# Altium schematic sheet Top_Sheet.SchDoc
size 420 x 297 mm; SheetNumber: 1; SheetTotal: 5
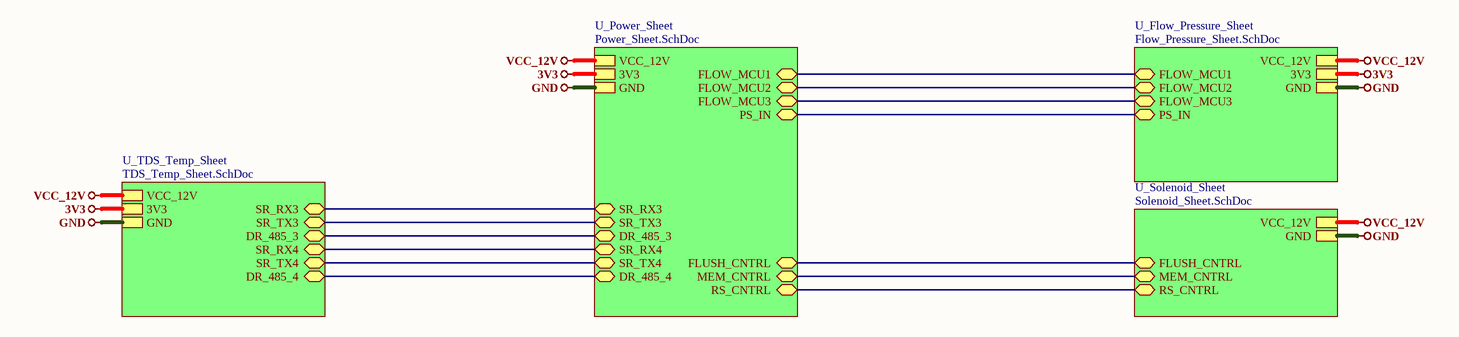
[diagram p0: Top_Sheet.SchDoc]

## Sub-sheets
U_Flow_Pressure_Sheet = Flow_Pressure_Sheet.SchDoc: VCC_12V, GND, 3V3, FLOW_MCU1 (bidir), FLOW_MCU2 (bidir), FLOW_MCU3 (bidir), PS_IN (bidir)
U_Power_Sheet = Power_Sheet.SchDoc: VCC_12V, GND, 3V3, FLOW_MCU1 (bidir), FLOW_MCU2 (bidir), FLOW_MCU3 (bidir), PS_IN (bidir), SR_RX3 (bidir), SR_TX3 (bidir), DR_485_3 (bidir), SR_RX4 (bidir), SR_TX4 (bidir), DR_485_4 (bidir), RS_CNTRL (bidir), MEM_CNTRL (bidir), FLUSH_CNTRL (bidir)
U_Solenoid_Sheet = Solenoid_Sheet.SchDoc: VCC_12V, GND, RS_CNTRL (bidir), MEM_CNTRL (bidir), FLUSH_CNTRL (bidir)
U_TDS_Temp_Sheet = TDS_Temp_Sheet.SchDoc: VCC_12V, GND, 3V3, SR_RX3 (bidir), SR_TX3 (bidir), DR_485_3 (bidir), SR_RX4 (bidir), SR_TX4 (bidir), DR_485_4 (bidir)

## Nets
3V3: sheet U_Power_Sheet/3V3, sheet U_TDS_Temp_Sheet/3V3, sheet U_Flow_Pressure_Sheet/3V3
GND: sheet U_Power_Sheet/GND, sheet U_TDS_Temp_Sheet/GND, sheet U_Solenoid_Sheet/GND, sheet U_Flow_Pressure_Sheet/GND
VCC_12V: sheet U_Power_Sheet/VCC_12V, sheet U_TDS_Temp_Sheet/VCC_12V, sheet U_Solenoid_Sheet/VCC_12V, sheet U_Flow_Pressure_Sheet/VCC_12V
(unnamed): sheet U_Power_Sheet/FLOW_MCU1, sheet U_Flow_Pressure_Sheet/FLOW_MCU1
(unnamed): sheet U_Power_Sheet/FLOW_MCU2, sheet U_Flow_Pressure_Sheet/FLOW_MCU2
(unnamed): sheet U_Power_Sheet/FLOW_MCU3, sheet U_Flow_Pressure_Sheet/FLOW_MCU3
(unnamed): sheet U_Power_Sheet/PS_IN, sheet U_Flow_Pressure_Sheet/PS_IN
(unnamed): sheet U_Power_Sheet/SR_RX3, sheet U_TDS_Temp_Sheet/SR_RX3
(unnamed): sheet U_Power_Sheet/SR_TX3, sheet U_TDS_Temp_Sheet/SR_TX3
(unnamed): sheet U_Power_Sheet/DR_485_3, sheet U_TDS_Temp_Sheet/DR_485_3
(unnamed): sheet U_Power_Sheet/SR_RX4, sheet U_TDS_Temp_Sheet/SR_RX4
(unnamed): sheet U_Power_Sheet/SR_TX4, sheet U_TDS_Temp_Sheet/SR_TX4
(unnamed): sheet U_Power_Sheet/DR_485_4, sheet U_TDS_Temp_Sheet/DR_485_4
(unnamed): sheet U_Power_Sheet/RS_CNTRL, sheet U_Solenoid_Sheet/RS_CNTRL
(unnamed): sheet U_Power_Sheet/MEM_CNTRL, sheet U_Solenoid_Sheet/MEM_CNTRL
(unnamed): sheet U_Power_Sheet/FLUSH_CNTRL, sheet U_Solenoid_Sheet/FLUSH_CNTRL

## Notes on the sheet
- File:
- Title:
- Date:
- Page
- Num:
- Total:
- Drawn By: Huzaifa Ali